# Altium schematic sheet Peripherals.SchDoc
size A; SheetNumber: 4; SheetTotal: 5
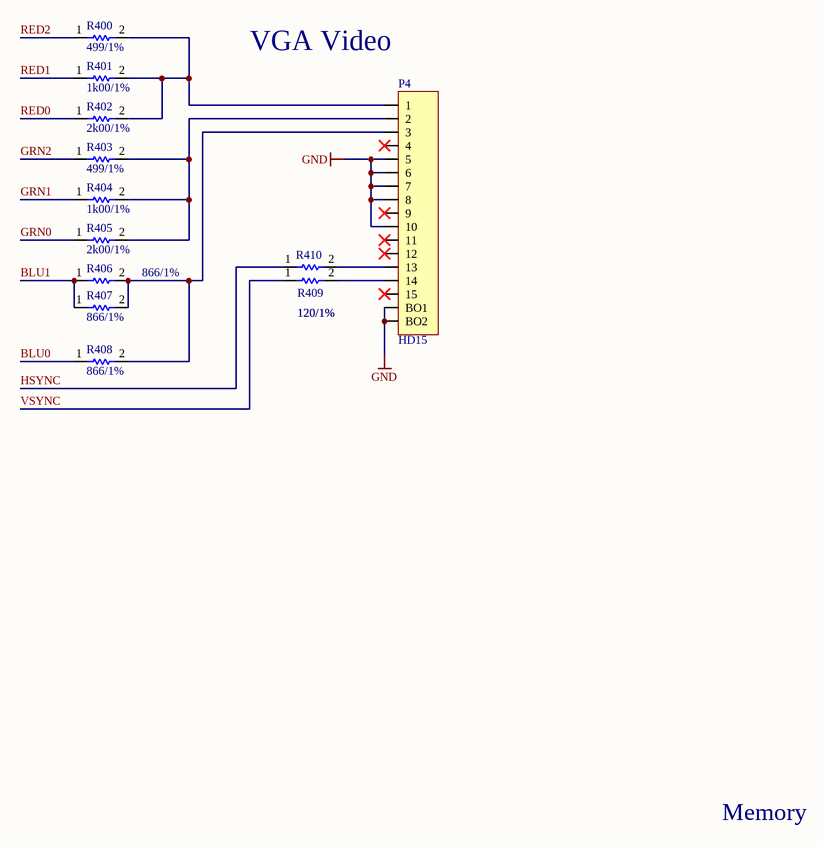
[diagram p0: Peripherals.SchDoc]

## Parts
P4  HD15  [DB15FLC]
R400  499/1%  [RNF14]
R401  1k00/1%  [RNF14]
R402  2k00/1%  [RNF14]
R403  499/1%  [RNF14]
R404  1k00/1%  [RNF14]
R405  2k00/1%  [RNF14]
R406  866/1%  [RNF14]
R407  866/1%  [RNF14]
R408  866/1%  [RNF14]
R409  120/1%  [RNF14]
R410  120/1%  [RNF14]

## Nets
GND: P4.5 P4.6 P4.7 P4.8 P4.10 P4.BO1 P4.BO2
BLU0: R408.1
BLU1: R406.1 R407.1
GRN0: R405.1
GRN1: R404.1
GRN2: R403.1
HSYNC: R410.1
RED0: R402.1
RED1: R401.1
RED2: R400.1
VSYNC: R409.1
NetP4_1: P4.1 R400.2 R401.2 R402.2
NetP4_2: P4.2 R403.2 R404.2 R405.2
NetP4_3: P4.3 R406.2 R407.2 R408.2
NetP4_13: P4.13 R410.2
NetP4_14: P4.14 R409.2

Not connected (* = marked no-connect by the designer): P4 4* 9* 11* 12* 15*

## Notes on the sheet
- (near P4) VGA Video
- Memory

## Library data of the parts
P4 = HD15: CONN DSUB HD RCPT 15POS R/A SLDR; Text Field1: Amphenol; Mfg PN: ICD15S13E4GX00LF; DK PN: 609-5181-ND
R400 R403 = 499/1%: RES 499 OHM 1% 1/4W AXIAL; MFG PN: RNF14FTD499R; DK PN: RNF14FTD499RCT-ND; MFG: Stackpole; Populate: *
R401 R404 = 1k00/1%: RES 1K OHM 1% 1/4W AXIAL; MFG PN: RNF14FTD1K00; DK PN: RNF14FTD1K00CT-ND; MFG: Stackpole; Populate: *
R402 R405 = 2k00/1%: RES 2K OHM 1% 1/4W AXIAL; MFG PN: RNF14FTD2K00; DK PN: RNF14FTD2K00CT-ND; MFG: Stackpole; Populate: *
R406-R408 = 866/1%: RES 866 OHM 1% 1/4W AXIAL; MFG PN: RNF14FTD866R; DK PN: RNF14FTD866RCT-ND; MFG: Stackpole; Populate: *
R409 R410 = 120/1%: RES 120 OHM 1% 1/4W AXIAL; MFG PN: RNMF14FTC120R; DK PN: S120CACT-ND; MFG: Stackpole; Populate: *